# Altium schematic sheet Sheet1.SchDoc
size A4; SheetNumber: 1; SheetTotal: 4
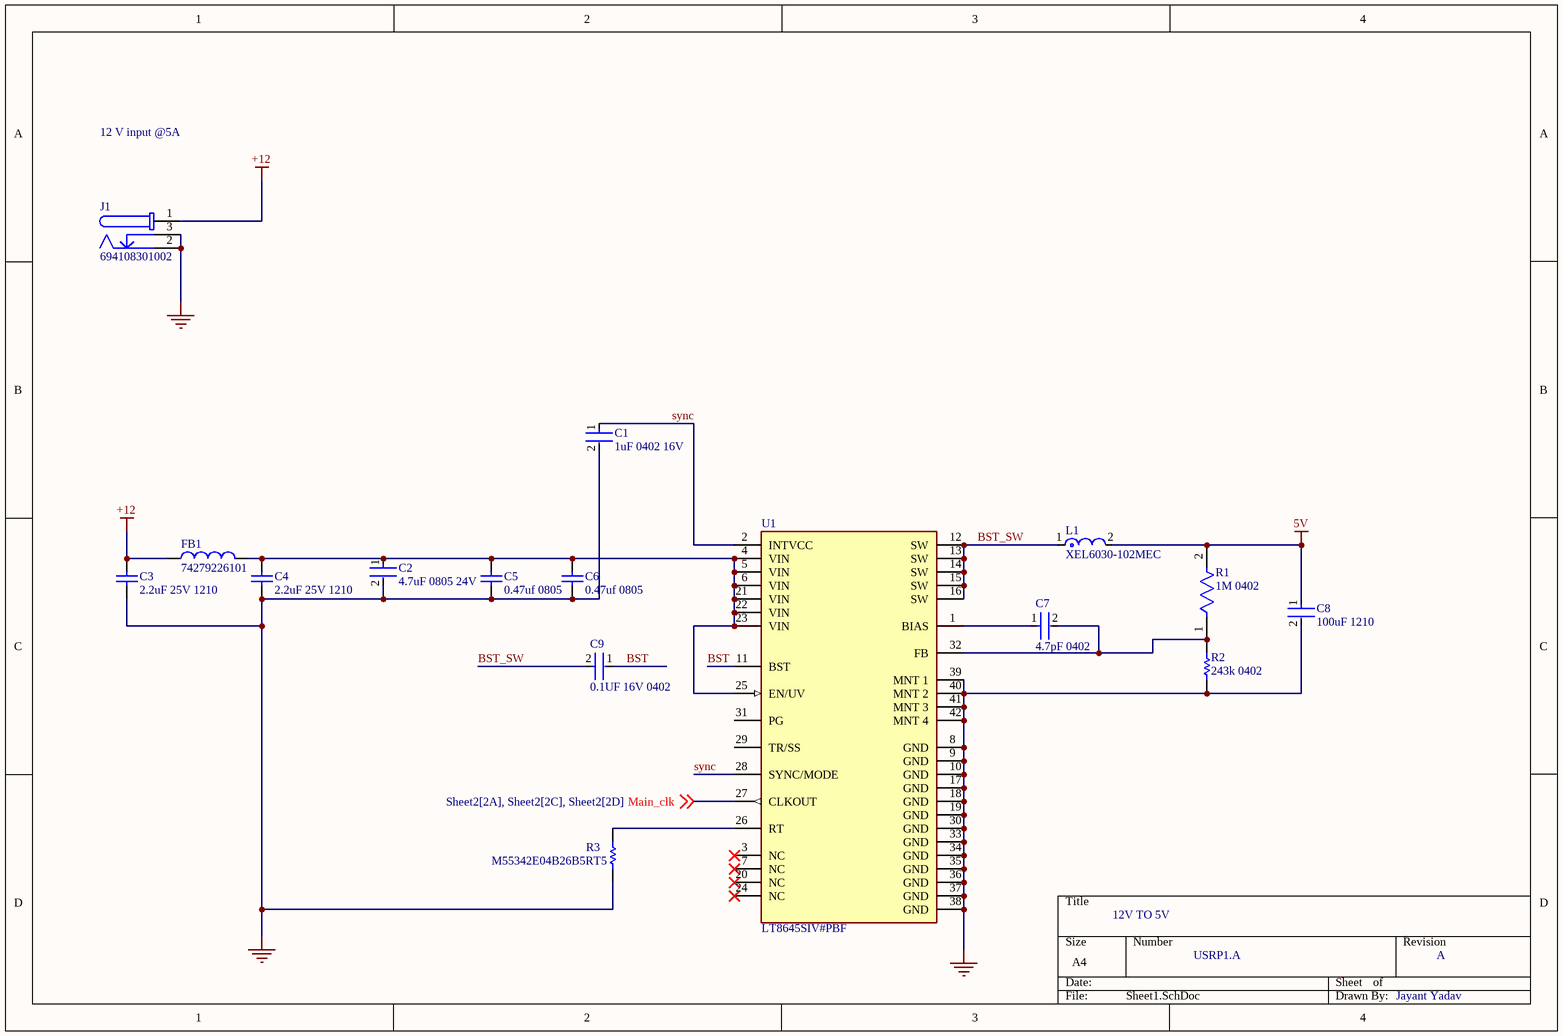
[diagram p0: Sheet1.SchDoc]

## Parts
C1  1uF 0402 16V  [FP-CC0402-MFG]
C2  4.7uF 0805 24V  [FP-C0805C475K3RACAUTO-MFG]
C3  2.2uF 25V 1210  [CAPC1210(3225)210_M]
C4  2.2uF 25V 1210  [CAPC1210(3225)210_M]
C5  0.47uf 0805  [CAPC2013X145X50NL20T25]
C6  0.47uf 0805  [CAPC2013X145X50NL20T25]
C7  4.7pF 0402  [FP-C0402-BB-MFG]
C8  100uF 1210  [FP-C1210C-FS-MFG]
C9  0.1UF 16V 0402  [FP-CC0402-0_05-0_55-L2_0-MFG]
FB1  74279226101  [WE-MPSB_1812_L4.5W3.2H2.3]
J1  694108301002  [694108301002]
L1  XEL6030-102MEC  [FP-XEL6030-3_1-MFG]
R1  1M 0402  [FP-MCS0402-IPC_C]
R2  243k 0402  [RESC1005X40X25NL05T05]
R3  M55342E04B26B5RT5  [RESC1005X40X25ML10T10]
U1  LT8645SIV#PBF  [FP-LQFN-32-05-08-1512-MFG]

## Nets
5V: C8.1 L1.2 R1.2
+12: C3.2 FB1.1 J1.1
GND: C1.2 C2.2 C3.1 C4.1 C5.1 C6.1 C8.2 J1.2 J1.3 R2.1 R3.1 U1.8(GND) U1.9(GND) U1.10(GND) U1.17(GND) U1.18(GND) U1.19(GND) U1.30(GND) U1.33(GND) U1.34(GND) U1.35(GND) U1.36(GND) U1.37(GND) U1.38(GND) U1.39(MNT_1) U1.40(MNT_2) U1.41(MNT_3) U1.42(MNT_4)
BST: C9.1 U1.11(BST)
BST_SW: C9.2 L1.1 U1.12(SW) U1.13(SW) U1.14(SW) U1.15(SW) U1.16(SW)
Main_clk: U1.27(CLKOUT) ; off-sheet Main_clk
sync: C1.1 U1.2(INTVCC) U1.28(SYNC/MODE)
NetC2_1: C2.1 C4.2 C5.2 C6.2 FB1.2 U1.4(VIN) U1.5(VIN) U1.6(VIN) U1.21(VIN) U1.22(VIN) U1.23(VIN) U1.25(EN/UV)
NetC7_1: C7.1 U1.1(BIAS)
NetC7_2: C7.2 R1.1 R2.2 U1.32(FB)
NetR3_2: R3.2 U1.26(RT)

Not connected (* = marked no-connect by the designer): U1 3(NC)* 7(NC)* 20(NC)* 24(NC)* 29(TR/SS) 31(PG)

## Notes on the sheet
- 12 V input @5A
- 12V TO 5V
- USRP1.A
- A
- Jayant Yadav

## Library data of the parts
C1 = CMP-03422-000064-1: CC0402 1 uF X5R 10.00% 16 V; Manufacturer: YAGEO; Manufacturer Part Number: CC0402KPX5R7BB105; Tolerance: 0.1; Automotive Grade: NA; Material: Ceramic; Temperature Coefficient: 30ppm/°C; Footprint Url: http://www.yageo.com/exep/pages/download/literatures/UPY-C_GEN_24.pdf; Temperature Characteristic: X5R; Device Class L3: Ceramic Capacitors; Category: Cap; ComponentLink2URL: http://www.yageo.com/documents/recent/UPY-GP_NP0_16V-to-50V_16.pdf; Voltage Rating: 16 V; Temperature Range Low: -55°C; Ipc Land Pattern Name: CAPC10050X50; Height: 0.55mm; Temperature: -55°C to +125°C; Automotive: No; Lead Free: Yes; Device Class L2: Capacitors; Device Class L1: Passive Components; Value: 1 uF; Temperature Range High: +125°C; Octopart: https://octopart.com/cc0402kpx5r7bb105-yageo-89998189; Capacitance: 1 uF; ComponentLink2Description: Datasheet; Package: CC0402; RoHS: TRUE
C2 = CMP-03020-034682-1: CAP CER 0805 4.7UF 25V X7R  10%; RoHS Compliant: Yes
C3 C4 = CMP-1038-02085-1: CAP 2.2uF 25V ±5% 1210 (3225 Metric) Thickness 2.05mm SMD; Case-Metric: 3225; Case-EIA: 1210; Tolerance: Â±5%; Technology: SMT; Max Thickness: 2.05 mm; Value: 2.2uF; Rated Voltage: 25 V
C5 C6 = CMP-2007-01148-1: Part Number: C0805C474K3RALTU; Manufacturer: Kemet
C7 = CMP-03020-005498-1: C0402 4.7 pF C0G 0.1 pF 50 V; Manufacturer: Kemet; Manufacturer Part Number: C0402C479B5GACAUTO; Tolerance: 0.1 pF; Temperature Coefficient: 15%; Material: Ceramic; Voltage Rating: 50 V; Temperature Range High: +125°C; Device Class L2: Capacitors; Package: C0402-BB; Temperature Range Low: -55°C; Capacitance: 4.7 pF; Category: Cap; RoHS: TRUE; ComponentLink2URL: https://content.kemet.com/datasheets/KEM_C1002_X7R_SMD.pdf; Height: 0.55mm; Lead Free: Yes; Mouser Description: Cap Ceramic 4.7pF 50V C0G 0.1pF SMD 0402 125°C T/R; Octopart: https://octopart.com/c0402c479b5gacauto-kemet-87334100; Value: 4.7 pF; Automotive: No; Device Class L3: Ceramic Capacitors; Ipc Land Pattern Name: CAPC10050X50; Temperature Characteristic: C0G; Device Class L1: Passive Components; Temperature: -55°C to +125°C; ComponentLink2Description: Datasheet
C8 = CMP-03020-034653-1: CAP CER 100UF 16V X5R 1210; Tolerance: 20%; Dielectric Material: Ceramic; Max Operating Temperature: 85°C; REACH SVHC: No SVHC; Case Code (Metric): 3225; Case/Package: 1210; Thickness: 0.106inch; Length: 3.2mm; Min Operating Temperature: -55°C; Voltage Rating (DC): 16V; Weight: 0.000564oz; Packaging: Tape and Reel; Case Code (Imperial): 1210; Depth: 2.5mm; Lead Free: Lead Free; Width: 0.098inch; Voltage Rating: 16V; Capacitance: 100uF; Termination: SMD/SMT; Dielectric: X5R; Package Quantity: 1000
C9 = CMP-03422-001485-1: CAP CER 0.1UF 16V X7R 0402; Tolerance: 5%; Capacitance: 100nF; Lead Free: Lead Free; Halogen Free: Halogen Free; Voltage Rating (DC): 16V; Thickness: 0.022inch; Resistor Type: Ceramic; Min Operating Temperature: -55°C; Width: 0.02inch; Voltage Rating: 16V; Package Quantity: 10000; Case/Package: 0402; Height: 0.5mm; Dielectric: X7R; Length: 1mm; Construction: Flat; Radiation Hardening: No; Case Code (Metric): 1005; Case Code (Imperial): 0402; Series: CC; Depth: 0.5mm; RoHS Compliant: Yes; Packaging: Tape and Reel; Mount: Surface Mount; Max Operating Temperature: 125°C
FB1 = CMP-1395-00002-2: NexarPartId: 21273894; Test Frequency: 100MHz; Impedance: 100Ω; Material: Ferrite, Steel; Max Current Rating: 8A; Frequency: 1.1GHz; Number of Lines: 1; DC Resistance (DCR): 4.5mΩ; Tolerance: 25%; Case Code (Metric): 4532; Mount: Surface Mount; Case Code (Imperial): 1812; Lead Free: Lead Free; Height: 2.3mm; Current Rating: 8A; Case/Package: 1812; Termination: SMD/SMT; REACH SVHC: Unknown; Max Operating Temperature: 125°C; Width: 3.2mm; Packaging: Digi-Reel®; Max DC Current: 8A; Min Operating Temperature: -55°C; RoHS: Compliant; Length: 4.5mm; Depth: 3.2mm
J1 = CMP-1502-00190-4: DC Power Jack Connector WR-DC, Male, Right Angled, THT, 5 A, 24 V; Operating Supply Voltage: 24V; Shielding: Unshielded; Voltage Rating: 30V; Number of Contacts: 3; Insulation Resistance: 100MΩ; Current Rating: 5A; Min Operating Temperature: -40°C; Packaging: Bulk; Connector Type: Power; Housing Material: Polyamide; REACH SVHC: Unknown; Termination: Through Hole; Contact Gender: Female; Mount: Through Hole; RoHS: Compliant; Flammability Rating: UL94 V-0; Height: 11mm; Max Operating Temperature: 85°C; Contact Plating: Tin; Color: Black; Gender: Male; Contact Material: Gold, Tin
L1 = CMP-11268-000097-1: Fixed Inductor 1uH Shld 20% 16A 6.95mOhms AECQ2; RoHS Compliant: Yes
R1 = CMP-02407-000443-1: RES SMD 1.2K OHM 1% 1/10W 0402; Voltage Rating (DC): 50V; Temperature Coefficient: 50ppm/°C; Resistance: 1MR; Power Rating: 63mW; Max Power Dissipation: 100mW; Radiation Hardening: No; Tolerance: 1%; Packaging: Tape and Reel; Case/Package: 0402; Case Code (Imperial): 0402; Width: 0.5mm; Lead Free: Lead Free; Composition: Thin Film; Mount: Surface Mount; Weight: 2.1E-05oz; Number of Terminations: 2; REACH SVHC: No SVHC; Depth: 0.5mm; Min Operating Temperature: -55°C; Height: 0.015inch; Max Operating Temperature: 125°C; Case Code (Metric): 1005; Package Quantity: 1; Military Standard: Not; Voltage Rating: 50V; Contact Plating: Tin; Length: 1mm
R2 = CMP-2002-08399-1: Manufacturer: Vishay Dale; Part Number: CRCW0402243KFKED
R3 = CMP-2002-05709-1: Manufacturer: TE Connectivity / AMP; Part Number: CRG0402F20K
U1 = CMP-09139-000710-1: IC REG BUCK ADJUSTABLE 8A 32LQFN; Output Voltage: 25V; Switching Frequency: 2.2MHz; Min Input Voltage: 3.4V; Max Input Voltage: 65V; Number of Outputs: 1; Quiescent Current: 400uA; Number of Pins: 32; Packaging: Rail/Tube; Min Supply Voltage: 3.4V; Package Quantity: 490; Output Current: 8A; Series: LT8645S; Max Operating Temperature: 125°C; RoHS Compliant: Yes; Min Operating Temperature: -40°C